# Altium schematic sheet PD Buck.SchDoc
size A3; SheetNumber: 13; SheetTotal: 16
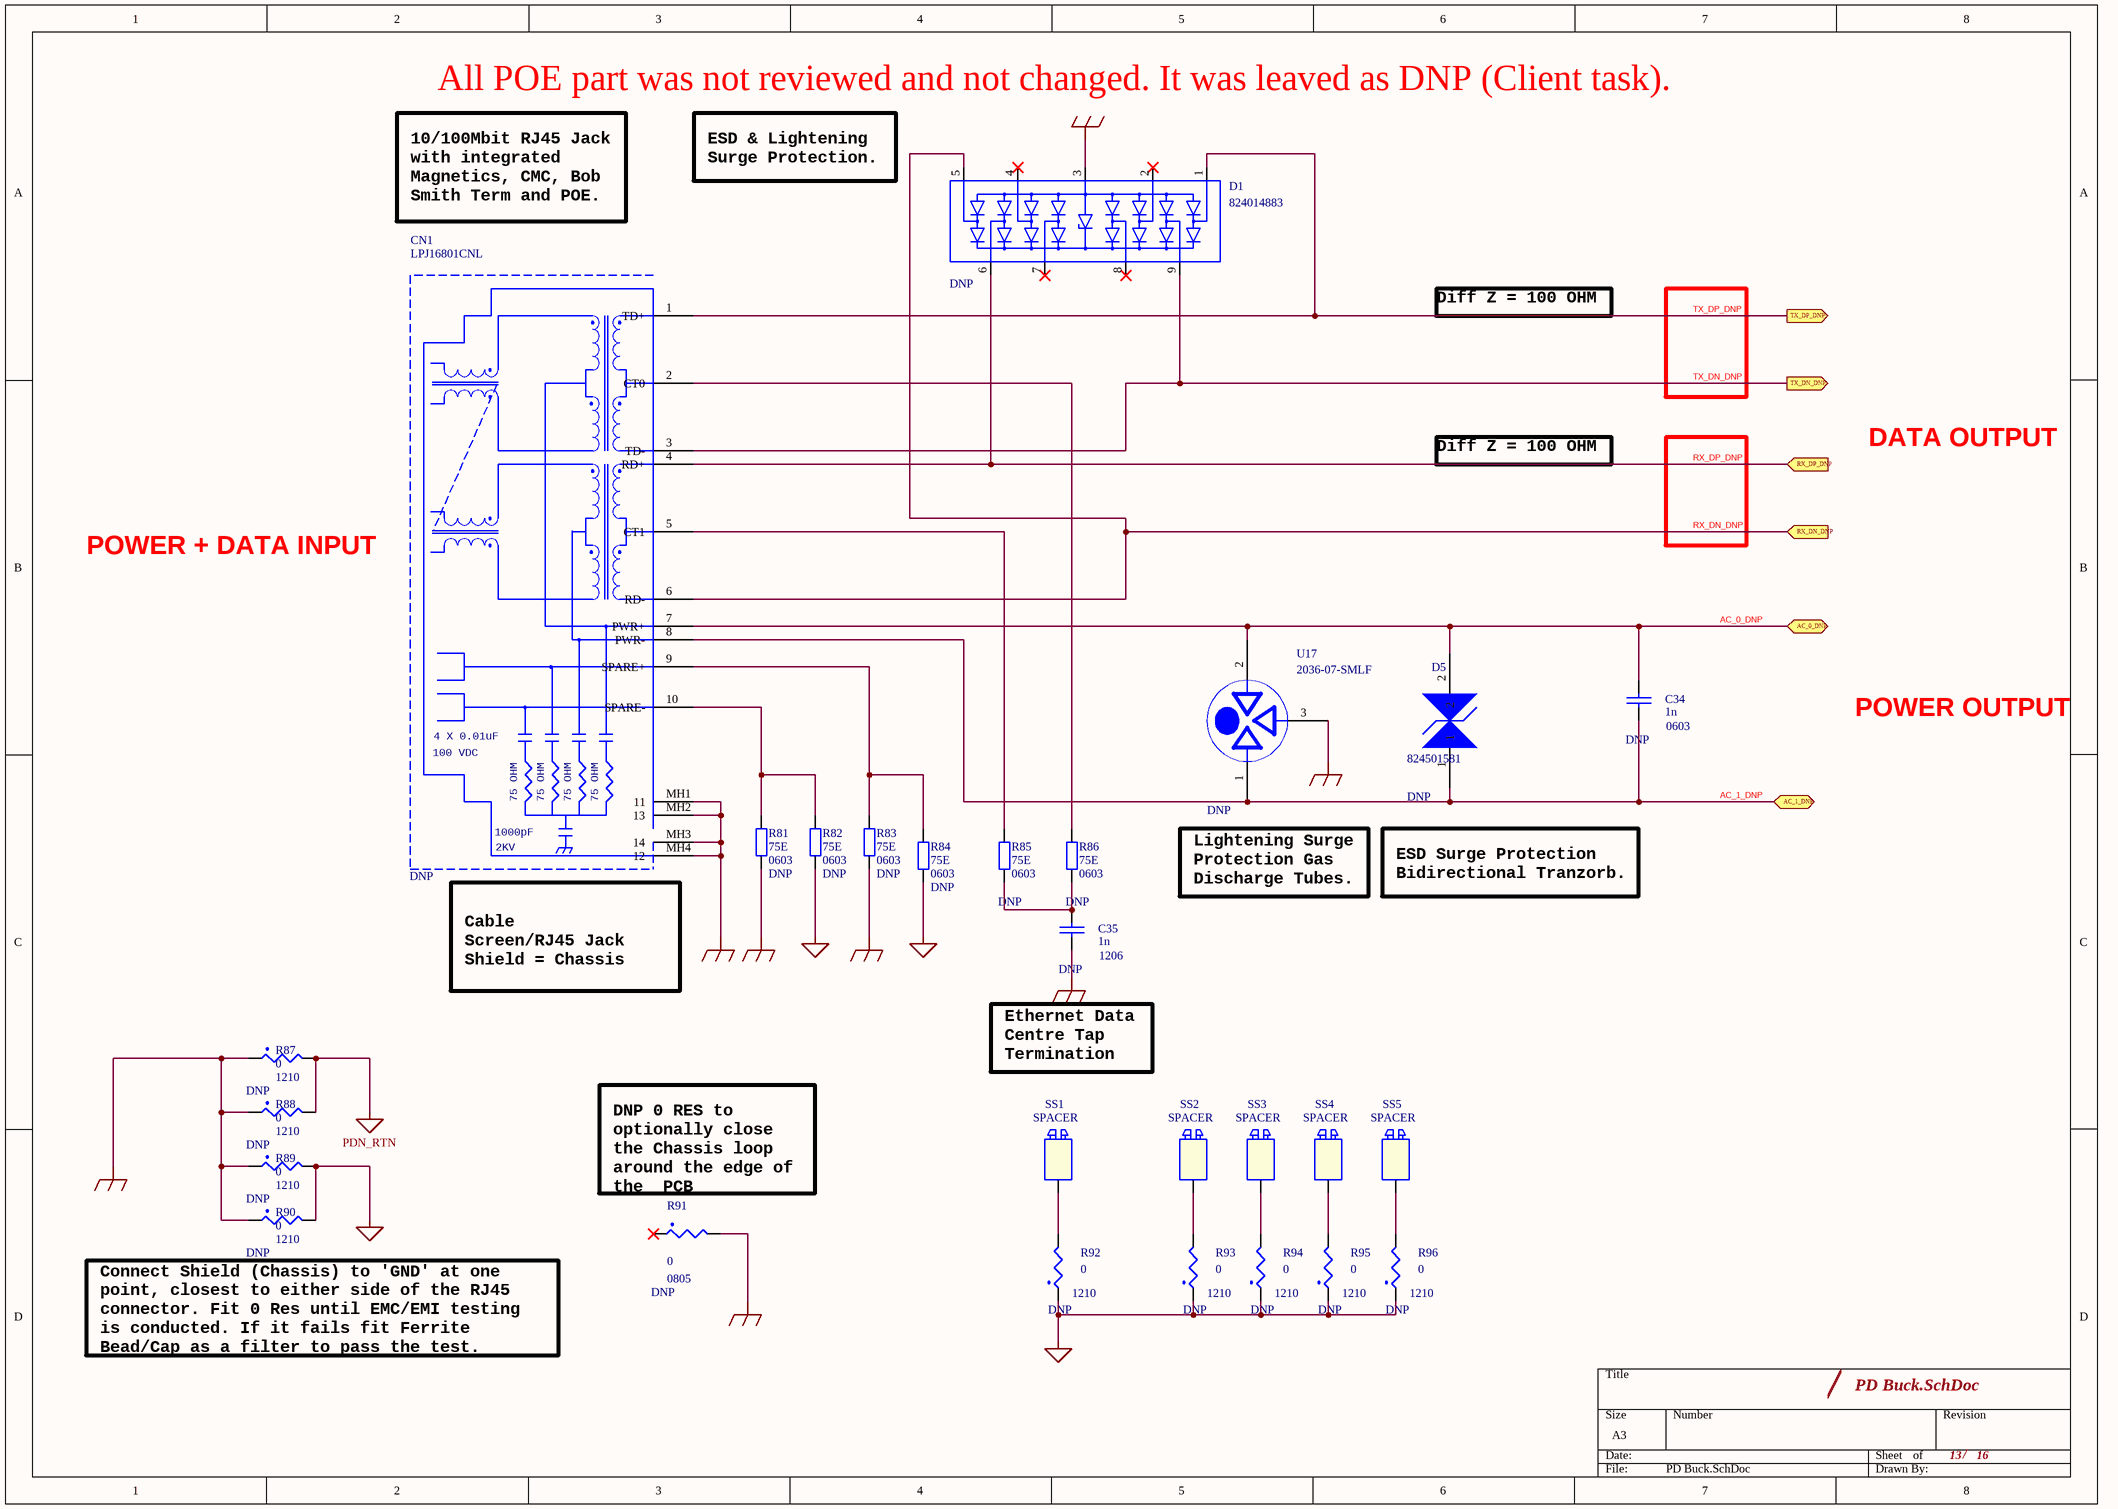
[diagram p0: PD Buck.SchDoc]

## Parts
C34  1n  Foot Print Type: 0603  [c_cs_0603]
C35  1n  Foot Print Type: 1206  [cap_sm_1206]
CN1  LPJ16801CNL  [LPJ16801CNL]
D1  824014883  [TVS_824014883]
D5  824501581  [824501581]
R81  Resistance: 75E  Size2: 0603  PMNT: DNP  [RESC160X80X55L30]  (hidden comment: RC0603FR-0775RP)
R82  Resistance: 75E  Size2: 0603  PMNT: DNP  [RESC160X80X55L30]  (hidden comment: RC0603FR-0775RP)
R83  Resistance: 75E  Size2: 0603  PMNT: DNP  [RESC160X80X55L30]  (hidden comment: RC0603FR-0775RP)
R84  Resistance: 75E  Size2: 0603  PMNT: DNP  [RESC160X80X55L30]  (hidden comment: RC0603FR-0775RP)
R85  Resistance: 75E  Size2: 0603  [RESC160X80X55L30]  (hidden comment: RC0603FR-0775RP)
R86  Resistance: 75E  Size2: 0603  [RESC160X80X55L30]  (hidden comment: RC0603FR-0775RP)
R87  0  Foot Print Size: 1210  [r_sm_1210]
R88  0  Foot Print Size: 1210  [r_sm_1210]
R89  0  Foot Print Size: 1210  [r_sm_1210]
R90  0  Foot Print Size: 1210  [r_sm_1210]
R91  0  Foot Print Size: 0805  [r_sm_0805]
R92  0  Foot Print Size: 1210  [r_sm_1210]
R93  0  Foot Print Size: 1210  [r_sm_1210]
R94  0  Foot Print Size: 1210  [r_sm_1210]
R95  0  Foot Print Size: 1210  [r_sm_1210]
R96  0  Foot Print Size: 1210  [r_sm_1210]
SS1  SPACER  [spacer_139t]
SS2  SPACER  [spacer_139t]
SS3  SPACER  [spacer_139t]
SS4  SPACER  [spacer_139t]
SS5  SPACER  [spacer_139t]
U17  2036-07-SMLF  [CHIP_07-SMLF]

## Ports
AC_0_DNP (bidir), AC_1_DNP (bidir), RX_DN_DNP (in), RX_DP_DNP (in), TX_DN_DNP (out), TX_DP_DNP (out)

## Nets
GND_EARTH: C35.2 CN1.MH1(11) CN1.MH2(13) CN1.MH3(14) CN1.MH4(12) D1.3(GND) R81.1 R83.1 R87.1 R88.1 R89.1 R90.1 R91.2 U17.3
GND_SIGNAL: R82.1 R84.1 R89.2 R90.2 R92.1 R93.1 R94.1 R95.1 R96.1
PDN_RTN: R87.2 R88.2
AC_0_DNP: C34.1 CN1.7(PWR+) D5.2 U17.2 ; port AC_0_DNP
AC_1_DNP: C34.2 CN1.8(PWR-) D5.1 U17.1 ; port AC_1_DNP
RX_DN_DNP: CN1.6(RD-) D1.5(I/O_4) ; port RX_DN_DNP
RX_DP_DNP: CN1.4(RD+) D1.6(I/O_5) ; port RX_DP_DNP
TX_DN_DNP: CN1.3(TD-) D1.9(I/O_8) ; port TX_DN_DNP
TX_DP_DNP: CN1.1(TD+) D1.1(I/O_1) ; port TX_DP_DNP
NetC35_1: C35.1 R85.1 R86.1
NetCN1_2: CN1.2(CT0) R86.2
NetCN1_5: CN1.5(CT1) R85.2
NetCN1_9: CN1.9(SPARE+) R83.2 R84.2
NetCN1_10: CN1.10(SPARE-) R81.2 R82.2
NetR92_2: R92.2 SS1.1(NC_1)
NetR93_2: R93.2 SS2.1(NC_1)
NetR94_2: R94.2 SS3.1(NC_1)
NetR95_2: R95.2 SS4.1(NC_1)
NetR96_2: R96.2 SS5.1(NC_1)

Not connected (* = marked no-connect by the designer): D1 2(I/O_2)* 4(I/O_3)* 7(I/O_6)* 8(I/O_7)*; R91 1*

## Notes on the sheet
- All POE part was not reviewed and not changed. It was leaved as DNP (Client task).
- ESD & Lightening
  Surge Protection.
- 10/100Mbit RJ45 Jack
  with integrated
  Magnetics, CMC, Bob
  Smith Term and POE.
- Diff Z = 100 OHM
- DATA OUTPUT
- POWER + DATA INPUT
- POWER OUTPUT
- Lightening Surge
  Protection Gas
  Discharge Tubes.
- ESD Surge Protection
  Bidirectional Tranzorb.
- Cable
  Screen/RJ45 Jack
  Shield = Chassis
- Ethernet Data
  Centre Tap
  Termination
- (near R91) DNP 0 RES to
  optionally close
  the Chassis loop
  around the edge of
  the  PCB
- (near R90) Connect Shield (Chassis) to 'GND' at one
  point, closest to either side of the RJ45
  connector. Fit 0 Res until EMC/EMI testing
  is conducted. If it fails fit Ferrite
  Bead/Cap as a filter to pass the test.
- /
- (in symbol LPJ16801CNL) 4 X 0.01uF; 100 VDC; 75 OHM; 1000pF; 2KV

## Library data of the parts
C34 = CAP_NP: CLASS: DISCRETE; Tollerance: 1%; Voltage: 50V; PCB Footprint: c_cs_0603; DNP: DNP
C35 = CAP_NP: CLASS: DISCRETE; Voltage: 50V; Tollerance: 1%; PCB Footprint: cap_sm_1206; DNP: DNP
D1 = 824014883: OriginalSymbolOrigin: (-30000,100000); PCB Footprint: TVS_824014883; DNP: DNP
R81-R86 = CMP-001-0628-7: RES 75 OHM 1% 1/10W 0603; Manufacturer: YAGEO; Power: 100mW; Temperature Coefficient: ±100ppm; Op Temp max: 155°C; Op Temp min: -55°C; Ratings: -; ComponentLink3URL: https://www.digikey.com/en/products/detail/yageo/RC0603FR-0710KL/726880?s=N4IgTCBcDaIEoGEAMA2JBmAYnAtEg7AIxIDSAMiALoC%2BQA; Size: 1.60mm x 0.80mm; ComponentLink1Description: Datasheet; ComponentLink3Description: Digikey; ComponentLink2Description: Mouser; ComponentLink1URL: https://www.yageo.com/upload/media/product/products/datasheet/rchip/PYu-RC_51_RoHS_P_4.pdf; Composition: Thick Film; Package: 0603 (1608 Metric); ComponentLink2URL: https://eu.mouser.com/ProductDetail/YAGEO/RC0603FR-0710KL?qs=grNVn54RoB%252B3GtjbJj3wJQ%3D%3D; Mounting Type: SM; Tolerance: 1%; Height max: 550µm; MPN: RC0603FR-0775RP; Component Type: Chip Resistor
  R85 R86: DNP: DNP
R87-R90 R92-R96 = SMD_RESISTOR: Tollerance: 5%; Voltage: 50V; PCB Footprint: r_sm_1210; DNP: DNP
R91 = SMD_RESISTOR: Voltage: 50V; Tollerance: 5%; PCB Footprint: r_sm_0805; DNP: DNP
SS1-SS5 = SPACER: CLASS: IC; PCB Footprint: spacer_139t
U17 = 2036-07-SMLF: Mfr_Name: Bourns Electronics; Copyright: Copyright (C) 2022 Ultra Librarian. All rights reserved.; Manufacturer_Part_Number: 2036-07-SMLF; PCB Footprint: CHIP_07-SMLF; DNP: DNP
CN1 = LPJ16801CNL: Part No: LPJ16801CNL; PCB Footprint: LPJ16801CNL; DNP: DNP
D5 = 824501581: PCB Footprint: 824501581; DNP: DNP